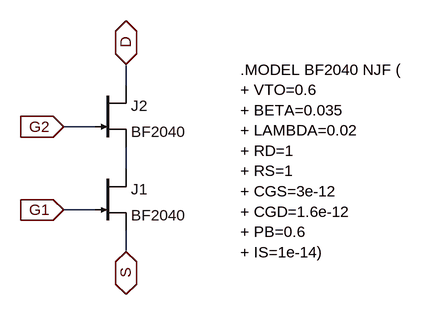
[diagram p0: schematic BF2040.asc]
BF2040.asc, the LTspice schematic file:
Version 4.1
SHEET 1 880 680
WIRE 240 -32 240 -64
WIRE 192 32 144 32
WIRE 240 96 240 64
WIRE 192 160 144 160
WIRE 240 224 240 192
FLAG 144 160 G1
IOPIN 144 160 In
FLAG 144 32 G2
IOPIN 144 32 In
FLAG 240 -64 D
IOPIN 240 -64 BiDir
FLAG 240 224 S
IOPIN 240 224 BiDir
SYMBOL njf 192 96 R0
SYMATTR InstName J1
SYMATTR Value BF2040
SYMBOL njf 192 -32 R0
SYMATTR InstName J2
SYMATTR Value BF2040
TEXT 416 -56 Left 2 !.MODEL BF2040 NJF (\n+ VTO=0.6\n+ BETA=0.035\n+ LAMBDA=0.02\n+ RD=1\n+ RS=1\n+ CGS=3e-12\n+ CGD=1.6e-12\n+ PB=0.6\n+ IS=1e-14)

The netlist it stands for:
* BF2040.asc
J1 N001 G1 S BF2040
J2 D G2 N001 BF2040
.model NJF NJF
.model PJF PJF
.lib standard.jft
.MODEL BF2040 NJF (
+ VTO=0.6
+ BETA=0.035
+ LAMBDA=0.02
+ RD=1
+ RS=1
+ CGS=3e-12
+ CGD=1.6e-12
+ PB=0.6
+ IS=1e-14)
.backanno
.end